# Altium schematic sheet 08_Display_Leds.SchDoc
size 558 x 431 mm; SheetNumber: 9; SheetTotal: 12
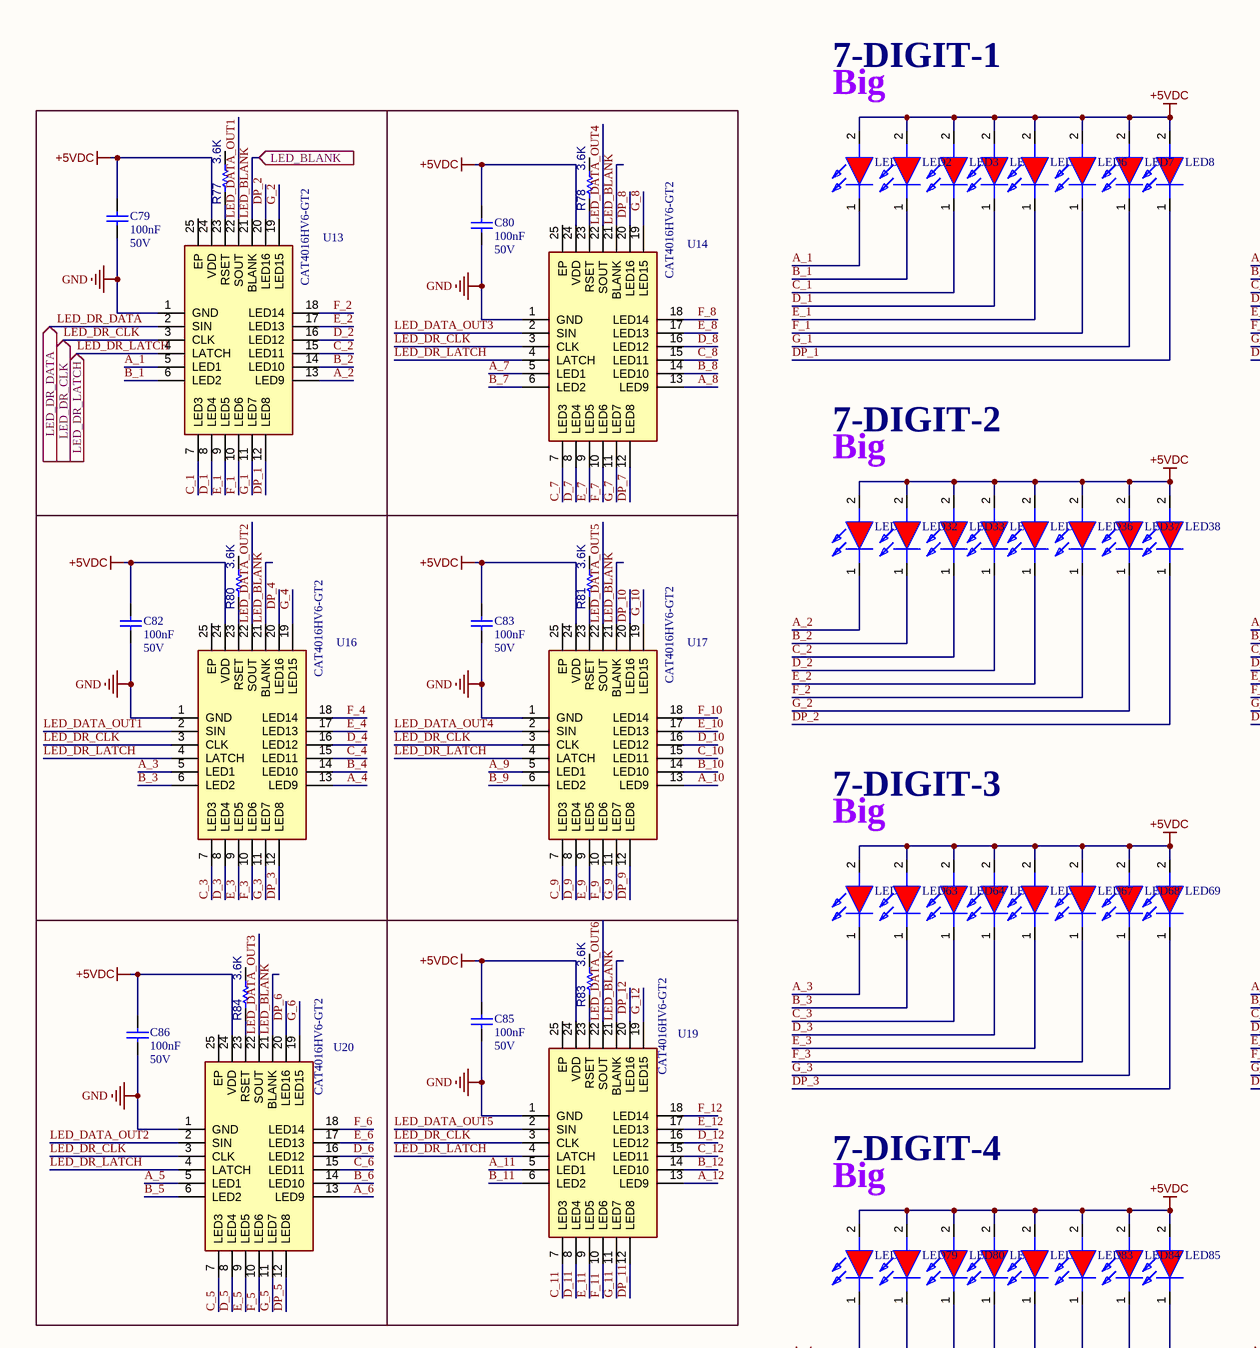
[diagram p0: 08_Display_Leds.SchDoc, top left]
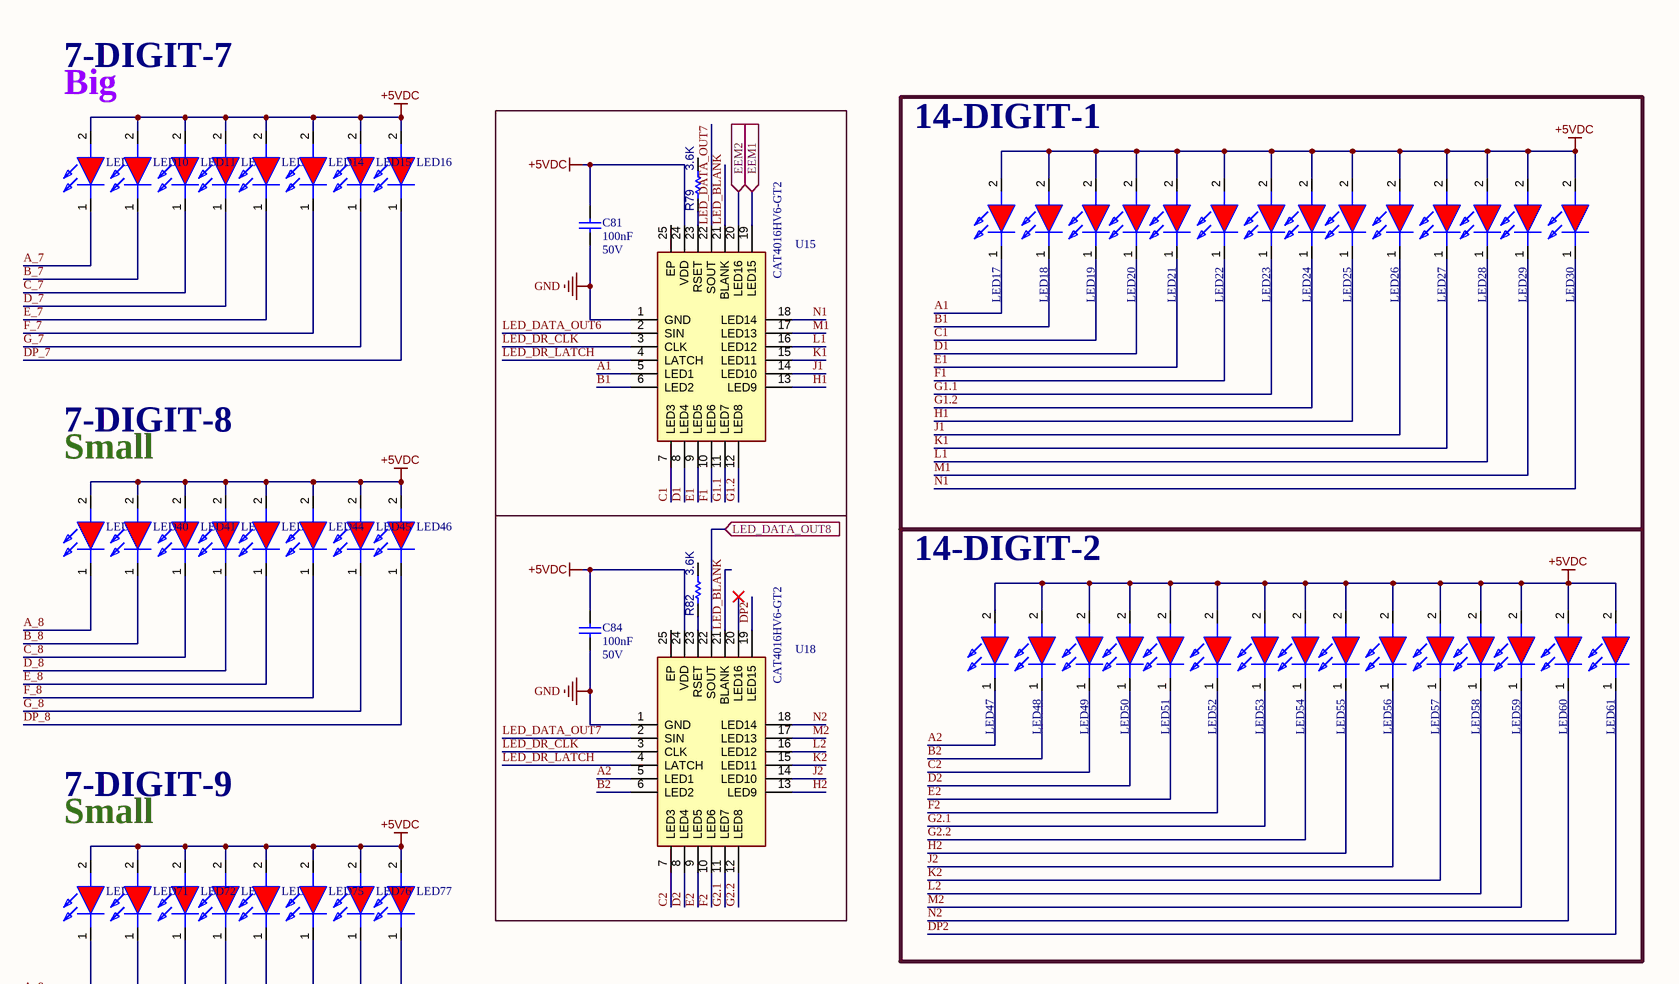
[diagram p1: 08_Display_Leds.SchDoc, top right]
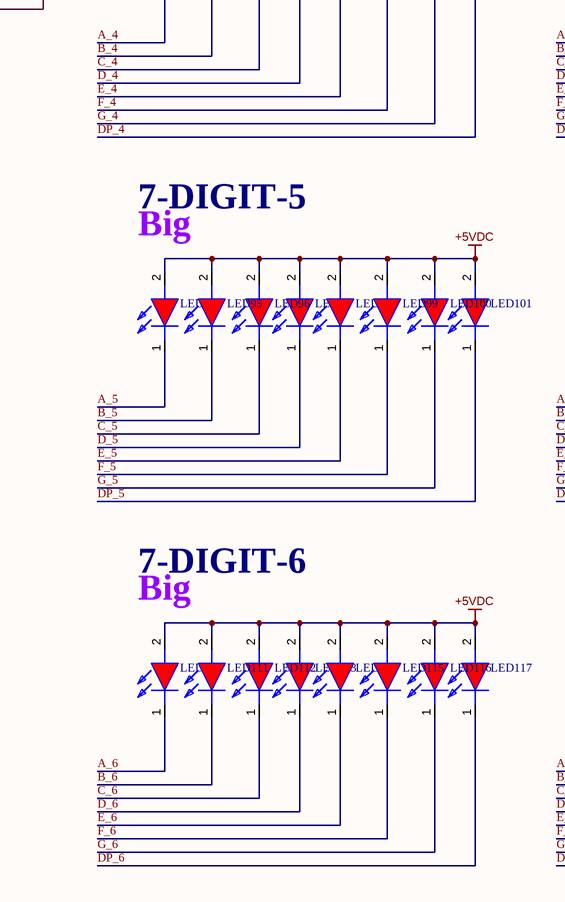
[diagram p2: 08_Display_Leds.SchDoc, bottom left]
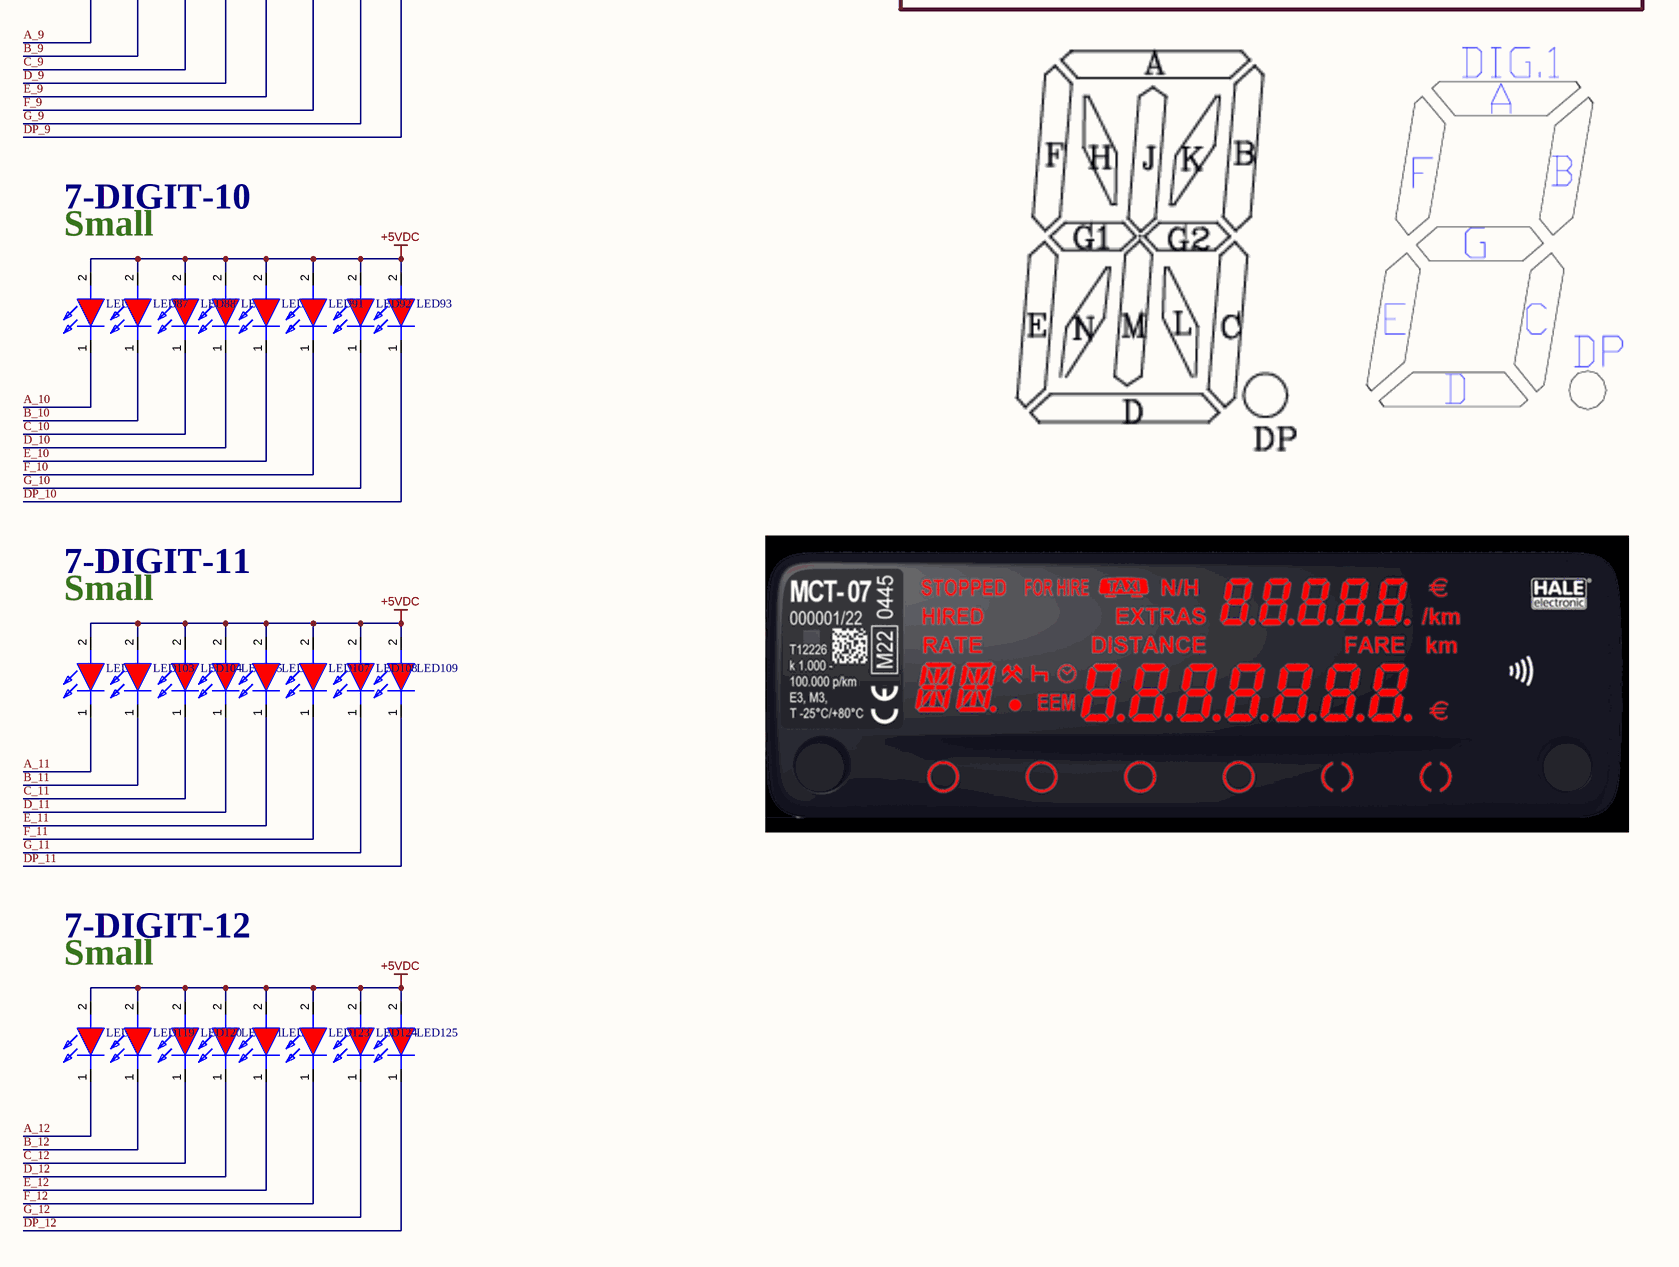
[diagram p3: 08_Display_Leds.SchDoc, bottom right]

## Parts
C79  value 100nF  Voltage: 50V  [CAP_0603]  (hidden comment: CAP)
C80  value 100nF  Voltage: 50V  [CAP_0603]  (hidden comment: CAP)
C81  value 100nF  Voltage: 50V  [CAP_0603]  (hidden comment: CAP)
C82  value 100nF  Voltage: 50V  [CAP_0603]  (hidden comment: CAP)
C83  value 100nF  Voltage: 50V  [CAP_0603]  (hidden comment: CAP)
C84  value 100nF  Voltage: 50V  [CAP_0603]  (hidden comment: CAP)
C85  value 100nF  Voltage: 50V  [CAP_0603]  (hidden comment: CAP)
C86  value 100nF  Voltage: 50V  [CAP_0603]  (hidden comment: CAP)
LED1  YLED0402R  [APHHS1005LSECKJ3PF]  (value not drawn)
LED2  YLED0402R  [APHHS1005LSECKJ3PF]  (value not drawn)
LED3  YLED0402R  [APHHS1005LSECKJ3PF]  (value not drawn)
LED4  YLED0402R  [APHHS1005LSECKJ3PF]  (value not drawn)
LED5  YLED0402R  [APHHS1005LSECKJ3PF]  (value not drawn)
LED6  YLED0402R  [APHHS1005LSECKJ3PF]  (value not drawn)
LED7  YLED0402R  [APHHS1005LSECKJ3PF]  (value not drawn)
LED8  YLED0402R  [APHHS1005LSECKJ3PF]  (value not drawn)
LED9  YLED0402R  [APHHS1005LSECKJ3PF]  (value not drawn)
LED10  YLED0402R  [APHHS1005LSECKJ3PF]  (value not drawn)
LED11  YLED0402R  [APHHS1005LSECKJ3PF]  (value not drawn)
LED12  YLED0402R  [APHHS1005LSECKJ3PF]  (value not drawn)
LED13  YLED0402R  [APHHS1005LSECKJ3PF]  (value not drawn)
LED14  YLED0402R  [APHHS1005LSECKJ3PF]  (value not drawn)
LED15  YLED0402R  [APHHS1005LSECKJ3PF]  (value not drawn)
LED16  YLED0402R  [APHHS1005LSECKJ3PF]  (value not drawn)
LED17  YLED0402R  [APHHS1005LSECKJ3PF]  (value not drawn)
LED18  YLED0402R  [APHHS1005LSECKJ3PF]  (value not drawn)
LED19  YLED0402R  [APHHS1005LSECKJ3PF]  (value not drawn)
LED20  YLED0402R  [APHHS1005LSECKJ3PF]  (value not drawn)
LED21  YLED0402R  [APHHS1005LSECKJ3PF]  (value not drawn)
LED22  YLED0402R  [APHHS1005LSECKJ3PF]  (value not drawn)
LED23  YLED0402R  [APHHS1005LSECKJ3PF]  (value not drawn)
LED24  YLED0402R  [APHHS1005LSECKJ3PF]  (value not drawn)
LED25  YLED0402R  [APHHS1005LSECKJ3PF]  (value not drawn)
LED26  YLED0402R  [APHHS1005LSECKJ3PF]  (value not drawn)
LED27  YLED0402R  [APHHS1005LSECKJ3PF]  (value not drawn)
LED28  YLED0402R  [APHHS1005LSECKJ3PF]  (value not drawn)
LED29  YLED0402R  [APHHS1005LSECKJ3PF]  (value not drawn)
LED30  YLED0402R  [APHHS1005LSECKJ3PF]  (value not drawn)
LED31  YLED0402R  [APHHS1005LSECKJ3PF]  (value not drawn)
LED32  YLED0402R  [APHHS1005LSECKJ3PF]  (value not drawn)
LED33  YLED0402R  [APHHS1005LSECKJ3PF]  (value not drawn)
LED34  YLED0402R  [APHHS1005LSECKJ3PF]  (value not drawn)
LED35  YLED0402R  [APHHS1005LSECKJ3PF]  (value not drawn)
LED36  YLED0402R  [APHHS1005LSECKJ3PF]  (value not drawn)
LED37  YLED0402R  [APHHS1005LSECKJ3PF]  (value not drawn)
LED38  YLED0402R  [APHHS1005LSECKJ3PF]  (value not drawn)
LED39  YLED0402R  [APHHS1005LSECKJ3PF]  (value not drawn)
LED40  YLED0402R  [APHHS1005LSECKJ3PF]  (value not drawn)
LED41  YLED0402R  [APHHS1005LSECKJ3PF]  (value not drawn)
LED42  YLED0402R  [APHHS1005LSECKJ3PF]  (value not drawn)
LED43  YLED0402R  [APHHS1005LSECKJ3PF]  (value not drawn)
LED44  YLED0402R  [APHHS1005LSECKJ3PF]  (value not drawn)
LED45  YLED0402R  [APHHS1005LSECKJ3PF]  (value not drawn)
LED46  YLED0402R  [APHHS1005LSECKJ3PF]  (value not drawn)
LED47  YLED0402R  [APHHS1005LSECKJ3PF]  (value not drawn)
LED48  YLED0402R  [APHHS1005LSECKJ3PF]  (value not drawn)
LED49  YLED0402R  [APHHS1005LSECKJ3PF]  (value not drawn)
LED50  YLED0402R  [APHHS1005LSECKJ3PF]  (value not drawn)
LED51  YLED0402R  [APHHS1005LSECKJ3PF]  (value not drawn)
LED52  YLED0402R  [APHHS1005LSECKJ3PF]  (value not drawn)
LED53  YLED0402R  [APHHS1005LSECKJ3PF]  (value not drawn)
LED54  YLED0402R  [APHHS1005LSECKJ3PF]  (value not drawn)
LED55  YLED0402R  [APHHS1005LSECKJ3PF]  (value not drawn)
LED56  YLED0402R  [APHHS1005LSECKJ3PF]  (value not drawn)
LED57  YLED0402R  [APHHS1005LSECKJ3PF]  (value not drawn)
LED58  YLED0402R  [APHHS1005LSECKJ3PF]  (value not drawn)
LED59  YLED0402R  [APHHS1005LSECKJ3PF]  (value not drawn)
LED60  YLED0402R  [APHHS1005LSECKJ3PF]  (value not drawn)
LED61  YLED0402R  [APHHS1005LSECKJ3PF]  (value not drawn)
LED62  YLED0402R  [APHHS1005LSECKJ3PF]  (value not drawn)
LED63  YLED0402R  [APHHS1005LSECKJ3PF]  (value not drawn)
LED64  YLED0402R  [APHHS1005LSECKJ3PF]  (value not drawn)
LED65  YLED0402R  [APHHS1005LSECKJ3PF]  (value not drawn)
LED66  YLED0402R  [APHHS1005LSECKJ3PF]  (value not drawn)
LED67  YLED0402R  [APHHS1005LSECKJ3PF]  (value not drawn)
LED68  YLED0402R  [APHHS1005LSECKJ3PF]  (value not drawn)
LED69  YLED0402R  [APHHS1005LSECKJ3PF]  (value not drawn)
LED70  YLED0402R  [APHHS1005LSECKJ3PF]  (value not drawn)
LED71  YLED0402R  [APHHS1005LSECKJ3PF]  (value not drawn)
LED72  YLED0402R  [APHHS1005LSECKJ3PF]  (value not drawn)
LED73  YLED0402R  [APHHS1005LSECKJ3PF]  (value not drawn)
LED74  YLED0402R  [APHHS1005LSECKJ3PF]  (value not drawn)
LED75  YLED0402R  [APHHS1005LSECKJ3PF]  (value not drawn)
LED76  YLED0402R  [APHHS1005LSECKJ3PF]  (value not drawn)
LED77  YLED0402R  [APHHS1005LSECKJ3PF]  (value not drawn)
LED78  YLED0402R  [APHHS1005LSECKJ3PF]  (value not drawn)
LED79  YLED0402R  [APHHS1005LSECKJ3PF]  (value not drawn)
LED80  YLED0402R  [APHHS1005LSECKJ3PF]  (value not drawn)
LED81  YLED0402R  [APHHS1005LSECKJ3PF]  (value not drawn)
LED82  YLED0402R  [APHHS1005LSECKJ3PF]  (value not drawn)
LED83  YLED0402R  [APHHS1005LSECKJ3PF]  (value not drawn)
LED84  YLED0402R  [APHHS1005LSECKJ3PF]  (value not drawn)
LED85  YLED0402R  [APHHS1005LSECKJ3PF]  (value not drawn)
LED86  YLED0402R  [APHHS1005LSECKJ3PF]  (value not drawn)
LED87  YLED0402R  [APHHS1005LSECKJ3PF]  (value not drawn)
LED88  YLED0402R  [APHHS1005LSECKJ3PF]  (value not drawn)
LED89  YLED0402R  [APHHS1005LSECKJ3PF]  (value not drawn)
LED90  YLED0402R  [APHHS1005LSECKJ3PF]  (value not drawn)
LED91  YLED0402R  [APHHS1005LSECKJ3PF]  (value not drawn)
LED92  YLED0402R  [APHHS1005LSECKJ3PF]  (value not drawn)
LED93  YLED0402R  [APHHS1005LSECKJ3PF]  (value not drawn)
LED94  YLED0402R  [APHHS1005LSECKJ3PF]  (value not drawn)
LED95  YLED0402R  [APHHS1005LSECKJ3PF]  (value not drawn)
LED96  YLED0402R  [APHHS1005LSECKJ3PF]  (value not drawn)
LED97  YLED0402R  [APHHS1005LSECKJ3PF]  (value not drawn)
LED98  YLED0402R  [APHHS1005LSECKJ3PF]  (value not drawn)
LED99  YLED0402R  [APHHS1005LSECKJ3PF]  (value not drawn)
LED100  YLED0402R  [APHHS1005LSECKJ3PF]  (value not drawn)
LED101  YLED0402R  [APHHS1005LSECKJ3PF]  (value not drawn)
LED102  YLED0402R  [APHHS1005LSECKJ3PF]  (value not drawn)
LED103  YLED0402R  [APHHS1005LSECKJ3PF]  (value not drawn)
LED104  YLED0402R  [APHHS1005LSECKJ3PF]  (value not drawn)
LED105  YLED0402R  [APHHS1005LSECKJ3PF]  (value not drawn)
LED106  YLED0402R  [APHHS1005LSECKJ3PF]  (value not drawn)
LED107  YLED0402R  [APHHS1005LSECKJ3PF]  (value not drawn)
LED108  YLED0402R  [APHHS1005LSECKJ3PF]  (value not drawn)
LED109  YLED0402R  [APHHS1005LSECKJ3PF]  (value not drawn)
LED110  YLED0402R  [APHHS1005LSECKJ3PF]  (value not drawn)
LED111  YLED0402R  [APHHS1005LSECKJ3PF]  (value not drawn)
LED112  YLED0402R  [APHHS1005LSECKJ3PF]  (value not drawn)
LED113  YLED0402R  [APHHS1005LSECKJ3PF]  (value not drawn)
LED114  YLED0402R  [APHHS1005LSECKJ3PF]  (value not drawn)
LED115  YLED0402R  [APHHS1005LSECKJ3PF]  (value not drawn)
LED116  YLED0402R  [APHHS1005LSECKJ3PF]  (value not drawn)
LED117  YLED0402R  [APHHS1005LSECKJ3PF]  (value not drawn)
LED118  YLED0402R  [APHHS1005LSECKJ3PF]  (value not drawn)
LED119  YLED0402R  [APHHS1005LSECKJ3PF]  (value not drawn)
LED120  YLED0402R  [APHHS1005LSECKJ3PF]  (value not drawn)
LED121  YLED0402R  [APHHS1005LSECKJ3PF]  (value not drawn)
LED122  YLED0402R  [APHHS1005LSECKJ3PF]  (value not drawn)
LED123  YLED0402R  [APHHS1005LSECKJ3PF]  (value not drawn)
LED124  YLED0402R  [APHHS1005LSECKJ3PF]  (value not drawn)
LED125  YLED0402R  [APHHS1005LSECKJ3PF]  (value not drawn)
R77  value 3.6K  [RES_0603]  (hidden comment: RC0603FR-133K6L)
R78  value 3.6K  [RES_0603]  (hidden comment: RC0603FR-133K6L)
R79  value 3.6K  [RES_0603]  (hidden comment: RC0603FR-133K6L)
R80  value 3.6K  [RES_0603]  (hidden comment: RC0603FR-133K6L)
R81  value 3.6K  [RES_0603]  (hidden comment: RC0603FR-133K6L)
R82  value 3.6K  [RES_0603]  (hidden comment: RC0603FR-133K6L)
R83  value 3.6K  [RES_0603]  (hidden comment: RC0603FR-133K6L)
R84  value 3.6K  [RES_0603]  (hidden comment: RC0603FR-133K6L)
U13  CAT4016HV6-GT2  [QFN50P400X400X80-25N-D]
U14  CAT4016HV6-GT2  [QFN50P400X400X80-25N-D]
U15  CAT4016HV6-GT2  [QFN50P400X400X80-25N-D]
U16  CAT4016HV6-GT2  [QFN50P400X400X80-25N-D]
U17  CAT4016HV6-GT2  [QFN50P400X400X80-25N-D]
U18  CAT4016HV6-GT2  [QFN50P400X400X80-25N-D]
U19  CAT4016HV6-GT2  [QFN50P400X400X80-25N-D]
U20  CAT4016HV6-GT2  [QFN50P400X400X80-25N-D]

## Blocks framed on the sheet
14-DIGIT-1: LED17-LED30
14-DIGIT-2: LED47-LED61

## Ports
EEM1 (in), EEM2 (in), LED_BLANK (in), LED_DATA_OUT8 (in), LED_DR_CLK (in), LED_DR_DATA (in), LED_DR_LATCH (in)

## Nets
+5VDC: C79.1 C80.1 C81.1 C82.1 C83.1 C84.1 C85.1 C86.1 LED1.2(A) LED2.2(A) LED3.2(A) LED4.2(A) LED5.2(A) LED6.2(A) LED7.2(A) LED8.2(A) LED9.2(A) LED10.2(A) LED11.2(A) LED12.2(A) LED13.2(A) LED14.2(A) LED15.2(A) LED16.2(A) LED17.2(A) LED18.2(A) LED19.2(A) LED20.2(A) LED21.2(A) LED22.2(A) LED23.2(A) LED24.2(A) LED25.2(A) LED26.2(A) LED27.2(A) LED28.2(A) LED29.2(A) LED30.2(A) LED31.2(A) LED32.2(A) LED33.2(A) LED34.2(A) LED35.2(A) LED36.2(A) LED37.2(A) LED38.2(A) LED39.2(A) LED40.2(A) LED41.2(A) LED42.2(A) LED43.2(A) LED44.2(A) LED45.2(A) LED46.2(A) LED47.2(A) LED48.2(A) LED49.2(A) LED50.2(A) LED51.2(A) LED52.2(A) LED53.2(A) LED54.2(A) LED55.2(A) LED56.2(A) LED57.2(A) LED58.2(A) LED59.2(A) LED60.2(A) LED61.2(A) LED62.2(A) LED63.2(A) LED64.2(A) LED65.2(A) LED66.2(A) LED67.2(A) LED68.2(A) LED69.2(A) LED70.2(A) LED71.2(A) LED72.2(A) LED73.2(A) LED74.2(A) LED75.2(A) LED76.2(A) LED77.2(A) LED78.2(A) LED79.2(A) LED80.2(A) LED81.2(A) LED82.2(A) LED83.2(A) LED84.2(A) LED85.2(A) LED86.2(A) LED87.2(A) LED88.2(A) LED89.2(A) LED90.2(A) LED91.2(A) LED92.2(A) LED93.2(A) LED94.2(A) LED95.2(A) LED96.2(A) LED97.2(A) LED98.2(A) LED99.2(A) LED100.2(A) LED101.2(A) LED102.2(A) LED103.2(A) LED104.2(A) LED105.2(A) LED106.2(A) LED107.2(A) LED108.2(A) LED109.2(A) LED110.2(A) LED111.2(A) LED112.2(A) LED113.2(A) LED114.2(A) LED115.2(A) LED116.2(A) LED117.2(A) LED118.2(A) LED119.2(A) LED120.2(A) LED121.2(A) LED122.2(A) LED123.2(A) LED124.2(A) LED125.2(A) U13.24(VDD) U14.24(VDD) U15.24(VDD) U16.24(VDD) U17.24(VDD) U18.24(VDD) U19.24(VDD) U20.24(VDD)
GND: C79.2 C80.2 C81.2 C82.2 C83.2 C84.2 C85.2 C86.2 U13.1(GND) U14.1(GND) U15.1(GND) U16.1(GND) U17.1(GND) U18.1(GND) U19.1(GND) U20.1(GND)
A1: LED17.1(K) U15.5(LED1)
A2: LED47.1(K) U18.5(LED1)
A_1: LED1.1(K) U13.5(LED1)
A_2: LED31.1(K) U13.13(LED9)
A_3: LED62.1(K) U16.5(LED1)
A_4: LED78.1(K) U16.13(LED9)
A_5: LED94.1(K) U20.5(LED1)
A_6: LED110.1(K) U20.13(LED9)
A_7: LED9.1(K) U14.5(LED1)
A_8: LED39.1(K) U14.13(LED9)
A_9: LED70.1(K) U17.5(LED1)
A_10: LED86.1(K) U17.13(LED9)
A_11: LED102.1(K) U19.5(LED1)
A_12: LED118.1(K) U19.13(LED9)
B1: LED18.1(K) U15.6(LED2)
B2: LED48.1(K) U18.6(LED2)
B_1: LED2.1(K) U13.6(LED2)
B_2: LED32.1(K) U13.14(LED10)
B_3: LED63.1(K) U16.6(LED2)
B_4: LED79.1(K) U16.14(LED10)
B_5: LED95.1(K) U20.6(LED2)
B_6: LED111.1(K) U20.14(LED10)
B_7: LED10.1(K) U14.6(LED2)
B_8: LED40.1(K) U14.14(LED10)
B_9: LED71.1(K) U17.6(LED2)
B_10: LED87.1(K) U17.14(LED10)
B_11: LED103.1(K) U19.6(LED2)
B_12: LED119.1(K) U19.14(LED10)
C1: LED19.1(K) U15.7(LED3)
C2: LED49.1(K) U18.7(LED3)
C_1: LED3.1(K) U13.7(LED3)
C_2: LED33.1(K) U13.15(LED11)
C_3: LED64.1(K) U16.7(LED3)
C_4: LED80.1(K) U16.15(LED11)
C_5: LED96.1(K) U20.7(LED3)
C_6: LED112.1(K) U20.15(LED11)
C_7: LED11.1(K) U14.7(LED3)
C_8: LED41.1(K) U14.15(LED11)
C_9: LED72.1(K) U17.7(LED3)
C_10: LED88.1(K) U17.15(LED11)
C_11: LED104.1(K) U19.7(LED3)
C_12: LED120.1(K) U19.15(LED11)
D1: LED20.1(K) U15.8(LED4)
D2: LED50.1(K) U18.8(LED4)
D_1: LED4.1(K) U13.8(LED4)
D_2: LED34.1(K) U13.16(LED12)
D_3: LED65.1(K) U16.8(LED4)
D_4: LED81.1(K) U16.16(LED12)
D_5: LED97.1(K) U20.8(LED4)
D_6: LED113.1(K) U20.16(LED12)
D_7: LED12.1(K) U14.8(LED4)
D_8: LED42.1(K) U14.16(LED12)
D_9: LED73.1(K) U17.8(LED4)
D_10: LED89.1(K) U17.16(LED12)
D_11: LED105.1(K) U19.8(LED4)
D_12: LED121.1(K) U19.16(LED12)
DP2: LED61.1(K) U18.19(LED15)
DP_1: LED8.1(K) U13.12(LED8)
DP_2: LED38.1(K) U13.20(LED16)
DP_3: LED69.1(K) U16.12(LED8)
DP_4: LED85.1(K) U16.20(LED16)
DP_5: LED101.1(K) U20.12(LED8)
DP_6: LED117.1(K) U20.20(LED16)
DP_7: LED16.1(K) U14.12(LED8)
DP_8: LED46.1(K) U14.20(LED16)
DP_9: LED77.1(K) U17.12(LED8)
DP_10: LED93.1(K) U17.20(LED16)
DP_11: LED109.1(K) U19.12(LED8)
DP_12: LED125.1(K) U19.20(LED16)
E1: LED21.1(K) U15.9(LED5)
E2: LED51.1(K) U18.9(LED5)
E_1: LED5.1(K) U13.9(LED5)
E_2: LED35.1(K) U13.17(LED13)
E_3: LED66.1(K) U16.9(LED5)
E_4: LED82.1(K) U16.17(LED13)
E_5: LED98.1(K) U20.9(LED5)
E_6: LED114.1(K) U20.17(LED13)
E_7: LED13.1(K) U14.9(LED5)
E_8: LED43.1(K) U14.17(LED13)
E_9: LED74.1(K) U17.9(LED5)
E_10: LED90.1(K) U17.17(LED13)
E_11: LED106.1(K) U19.9(LED5)
E_12: LED122.1(K) U19.17(LED13)
EEM1: U15.19(LED15) ; port EEM1
EEM2: U15.20(LED16) ; port EEM2
F1: LED22.1(K) U15.10(LED6)
F2: LED52.1(K) U18.10(LED6)
F_1: LED6.1(K) U13.10(LED6)
F_2: LED36.1(K) U13.18(LED14)
F_3: LED67.1(K) U16.10(LED6)
F_4: LED83.1(K) U16.18(LED14)
F_5: LED99.1(K) U20.10(LED6)
F_6: LED115.1(K) U20.18(LED14)
F_7: LED14.1(K) U14.10(LED6)
F_8: LED44.1(K) U14.18(LED14)
F_9: LED75.1(K) U17.10(LED6)
F_10: LED91.1(K) U17.18(LED14)
F_11: LED107.1(K) U19.10(LED6)
F_12: LED123.1(K) U19.18(LED14)
G1.1: LED23.1(K) U15.11(LED7)
G1.2: LED24.1(K) U15.12(LED8)
G2.1: LED53.1(K) U18.11(LED7)
G2.2: LED54.1(K) U18.12(LED8)
G_1: LED7.1(K) U13.11(LED7)
G_2: LED37.1(K) U13.19(LED15)
G_3: LED68.1(K) U16.11(LED7)
G_4: LED84.1(K) U16.19(LED15)
G_5: LED100.1(K) U20.11(LED7)
G_6: LED116.1(K) U20.19(LED15)
G_7: LED15.1(K) U14.11(LED7)
G_8: LED45.1(K) U14.19(LED15)
G_9: LED76.1(K) U17.11(LED7)
G_10: LED92.1(K) U17.19(LED15)
G_11: LED108.1(K) U19.11(LED7)
G_12: LED124.1(K) U19.19(LED15)
H1: LED25.1(K) U15.13(LED9)
H2: LED55.1(K) U18.13(LED9)
J1: LED26.1(K) U15.14(LED10)
J2: LED56.1(K) U18.14(LED10)
K1: LED27.1(K) U15.15(LED11)
K2: LED57.1(K) U18.15(LED11)
L1: LED28.1(K) U15.16(LED12)
L2: LED58.1(K) U18.16(LED12)
LED_BLANK: U13.21(BLANK) U14.21(BLANK) U15.21(BLANK) U16.21(BLANK) U17.21(BLANK) U18.21(BLANK) U19.21(BLANK) U20.21(BLANK) ; port LED_BLANK
LED_DATA_OUT1: U13.22(SOUT) U16.2(SIN)
LED_DATA_OUT2: U16.22(SOUT) U20.2(SIN)
LED_DATA_OUT3: U14.2(SIN) U20.22(SOUT)
LED_DATA_OUT4: U14.22(SOUT) U17.2(SIN)
LED_DATA_OUT5: U17.22(SOUT) U19.2(SIN)
LED_DATA_OUT6: U15.2(SIN) U19.22(SOUT)
LED_DATA_OUT7: U15.22(SOUT) U18.2(SIN)
LED_DATA_OUT8: U18.22(SOUT) ; port LED_DATA_OUT8
LED_DR_CLK: U13.3(CLK) U14.3(CLK) U15.3(CLK) U16.3(CLK) U17.3(CLK) U18.3(CLK) U19.3(CLK) U20.3(CLK) ; port LED_DR_CLK
LED_DR_DATA: U13.2(SIN) ; port LED_DR_DATA
LED_DR_LATCH: U13.4(LATCH) U14.4(LATCH) U15.4(LATCH) U16.4(LATCH) U17.4(LATCH) U18.4(LATCH) U19.4(LATCH) U20.4(LATCH) ; port LED_DR_LATCH
M1: LED29.1(K) U15.17(LED13)
M2: LED59.1(K) U18.17(LED13)
N1: LED30.1(K) U15.18(LED14)
N2: LED60.1(K) U18.18(LED14)
NetR77_1: R77.1 U13.23(RSET)
NetR78_1: R78.1 U14.23(RSET)
NetR79_1: R79.1 U15.23(RSET)
NetR80_1: R80.1 U16.23(RSET)
NetR81_1: R81.1 U17.23(RSET)
NetR82_1: R82.1 U18.23(RSET)
NetR83_1: R83.1 U19.23(RSET)
NetR84_1: R84.1 U20.23(RSET)

Not connected (* = marked no-connect by the designer): R77 2; R78 2; R79 2; R80 2; R81 2; R82 2; R83 2; R84 2; U13 25(EP); U14 25(EP); U15 25(EP); U16 25(EP); U17 25(EP); U18 20(LED16)* 25(EP); U19 25(EP); U20 25(EP)

## Notes on the sheet
- 7-DIGIT-1
- Big
- 7-DIGIT-7
- 7-DIGIT-2
- 7-DIGIT-8
- Small
- 7-DIGIT-3
- 7-DIGIT-9
- 7-DIGIT-4
- 7-DIGIT-10
- 7-DIGIT-5
- 7-DIGIT-11
- 7-DIGIT-6
- 7-DIGIT-12
- DWG. NO.
- REV.
- SHT.
- REVISION
- DESCRIPTION
- DATE
- APPROVED
- THIS DOCUMENT AND THE DATA DISCLOSED HEREIN OR HEREWITH IS THE PROPERTY OF ALTIUM LIMITED AND MAY BE FREELY DISTRIBUTED IN WHOLE. NO RIGHTS ARE RESERVED OR EXPRESS OR IMPLIED WARANTEE GIVEN.
- ENG:
- DSN:
- APPROVALS
- PROJECT
- DOCUMENT REVISION:
- DESIGN ITEM:
- CHK:
- BOM:
- REFERENCE DOCUMENTS
- PROJECT REVISION:
- TITLE
- FAB DWG:
- PCB DWG:
- ASSY DWG:
- SCALE:
- SIZE
- C
- CAGE CODE
- FILE NAME
- DWG NO.
- SHEET
- OF
- REV

## Library data of the parts
C79-C86 = C01763: CAP CER 100nF 50VDC %10 X7R SMD; Manufacturer: Samsung; Manufacturer Part Number: CL10B104KB8NNNL
LED1-LED125 = YLED0402R: LED RED WATER CLEAR 0402 SMD; Manufacturer: Kingbright; Value: 0402; Manufacturer Part Number: YLED0402R
R77-R84 = 0603SAF3301T5E: RES.(1608) 0603 3.6K Ohms 1% 1/10W 100PPM SMT; Manufacturer: YAGEO; Manufacturer Part Number: RC0603FR-133K6L
U13-U20 = CAT4016HV6-GT2: Integrated Circuit; Manufacturer_Name: onsemi; Datasheet Link: https://www.onsemi.com/download/data-sheet/pdf/cat4016-d.pdf; Height: 0.8mm; Manufacturer_Part_Number: CAT4016HV6-GT2; Mouser Part Number: 698-CAT4016HV6-GT2; Mouser Price/Stock: https://www.mouser.co.uk/ProductDetail/onsemi/CAT4016HV6-GT2?qs=rZgeL6XvLwaPp0eUTTX%2FiA%3D%3D; Arrow Part Number: CAT4016HV6-GT2; Arrow Price/Stock: https://www.arrow.com/en/products/cat4016hv6-gt2/on-semiconductor